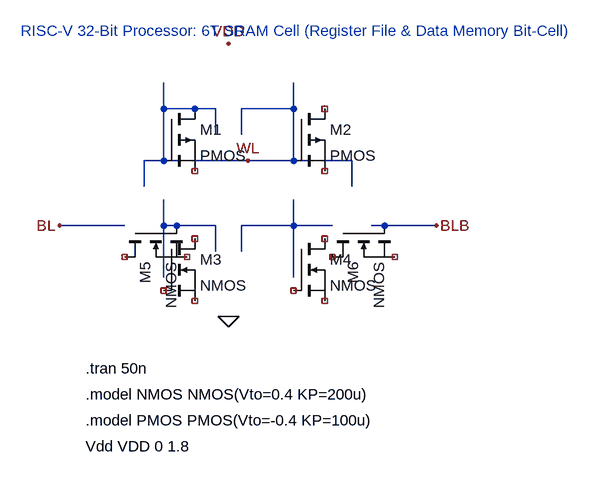
[diagram p0: schematic riscv_6t_sram_cell.asc]
riscv_6t_sram_cell.asc, the LTspice schematic file:
Version 4
SHEET 1 1100 800
WIRE 320 160 320 200
WIRE 320 200 400 200
WIRE 400 200 400 240
WIRE 320 200 320 280
WIRE 520 160 520 200
WIRE 520 200 440 200
WIRE 440 200 440 240
WIRE 520 200 520 280
WIRE 320 340 320 380
WIRE 320 380 400 380
WIRE 400 380 400 420
WIRE 320 380 320 460
WIRE 520 340 520 380
WIRE 520 380 440 380
WIRE 440 380 440 420
WIRE 520 380 520 460
WIRE 160 380 260 380
WIRE 320 380 320 380
WIRE 520 380 580 380
WIRE 640 380 740 380
WIRE 290 320 290 280
WIRE 290 280 610 280
WIRE 610 280 610 320
FLAG 420 100 VDD
FLAG 420 520 0
FLAG 160 380 BL
FLAG 740 380 BLB
FLAG 450 280 WL
SYMBOL pmos 320 200 R0
SYMATTR InstName M1
SYMATTR Value PMOS
SYMBOL pmos 520 200 R0
SYMATTR InstName M2
SYMATTR Value PMOS
SYMBOL nmos 320 400 R0
SYMATTR InstName M3
SYMATTR Value NMOS
SYMBOL nmos 520 400 R0
SYMATTR InstName M4
SYMATTR Value NMOS
SYMBOL nmos 260 380 M90
SYMATTR InstName M5
SYMATTR Value NMOS
SYMBOL nmos 580 380 M90
SYMATTR InstName M6
SYMATTR Value NMOS
TEXT 200 600 Left 2 !.tran 50n
TEXT 200 640 Left 2 !.model NMOS NMOS(Vto=0.4 KP=200u)
TEXT 200 680 Left 2 !.model PMOS PMOS(Vto=-0.4 KP=100u)
TEXT 200 720 Left 2 !Vdd VDD 0 1.8
TEXT 100 80 Left 2 ;RISC-V 32-Bit Processor: 6T SRAM Cell (Register File & Data Memory Bit-Cell)

The netlist it stands for:
* riscv_6t_sram_cell.asc
M1 WL WL NC_01 NC_01 PMOS
M2 NC_02 WL NC_03 NC_03 PMOS
* M3: NMOS (symbol nmos not certain, pin order unknown); nets seen at it: 
* M4: NMOS (symbol nmos not certain, pin order unknown); nets seen at it: 
* M5: NMOS (symbol nmos not certain, pin order unknown); nets seen at it: N001
* M6: NMOS (symbol nmos not certain, pin order unknown); nets seen at it: BLB
.model NMOS NMOS
.model PMOS PMOS
.lib standard.mos
.tran 50n
.model NMOS NMOS(Vto=0.4 KP=200u)
.model PMOS PMOS(Vto=-0.4 KP=100u)
Vdd VDD 0 1.8
* RISC-V 32-Bit Processor: 6T SRAM Cell (Register File & Data Memory Bit-Cell)
.backanno
.end